# Altium project 实验项目四.PrjPCB
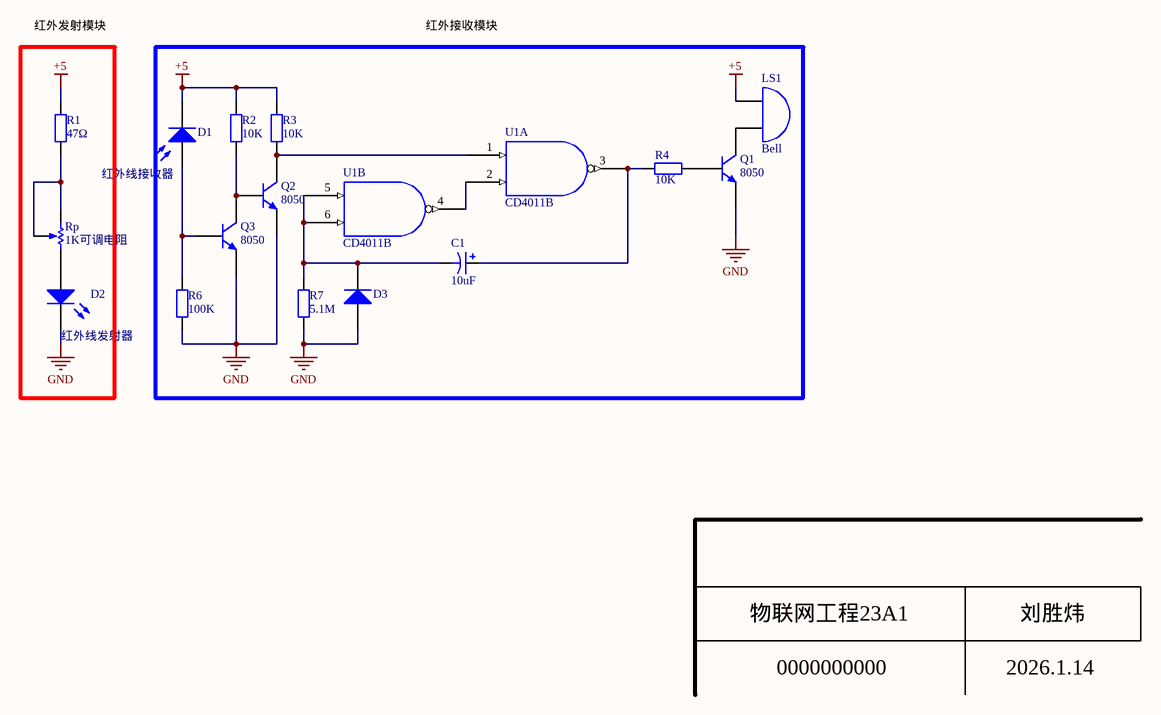
[diagram p0: 实验项目四.SchDoc]
1 sheet, 16 parts. Net scope: global (net labels, ports and power ports of the same name join across sheets).

## Sheet 实验项目四.SchDoc
size A4

### Parts
C1  value 10uF  [POLAR0.8]  (hidden comment: Cap Pol2)
D1  Photo Sen  [PIN2]  (value not drawn)
D2  LED3  [3.5X2.8X1.9]  (value not drawn)
D3  Diode  [SMC]  (value not drawn)
LS1  Bell  [PIN2]
Q1  8050  [SOT-23B_N]
Q2  8050  [SOT-23B_N]
Q3  8050  [SOT-23B_N]
R1  value 47Ω  [AXIAL-0.4]  (hidden comment: Res2)
R2  value 10K  [AXIAL-0.4]  (hidden comment: Res2)
R3  value 10K  [AXIAL-0.4]  (hidden comment: Res2)
R4  value 10K  [AXIAL-0.4]  (hidden comment: Res2)
R6  value 100K  [AXIAL-0.4]  (hidden comment: Res2)
R7  value 5.1M  [AXIAL-0.4]  (hidden comment: Res2)
Rp  1K可调电阻  [VR5]
U1  CD4011B  [DIP-14]  (parts A,B of 4)

### Blocks framed on the sheet
红外接收模块: C1 D1 D3 LS1 Q1-Q3 R2-R4 R6 R7 U1

### Nets
+5: D1.2(K) LS1.1(A) R1.1 R2.2 R3.2
GND: D2.2(K) D3.1(A) Q1.3(E) Q2.3(E) Q3.3(E) R6.1 R7.1 U1.7(GND)
VCC: U1.14(VCC)
NetC1_1: C1.1 R4.2 U1.3
NetC1_2: C1.2 D3.2(K) R7.2 U1.5 U1.6
NetD1_1: D1.1(A) Q3.2(B) R6.2
NetD2_1: D2.1(A) Rp.2(BOT)
NetLS1_2: LS1.2(B) Q1.1(C)
NetQ1_2: Q1.2(B) R4.1
NetQ2_1: Q2.1(C) R3.1 U1.1
NetQ2_2: Q2.2(B) Q3.1(C) R2.1
NetR1_2: R1.2 Rp.1(TOP) Rp.3(TAP)
NetU1_2: U1.2 U1.4

### Notes on the sheet
- 红外发射模块
- 红外线接收器
- (near D2) 红外线发射器
- 物联网工程23A1
- 0000000000
- 2026.1.14
- 刘胜炜

### Library data of the parts
C1 = Cap Pol2: Polarized Capacitor (Axial); Published: 8-Jun-2000; LatestRevisionDate: 17-Jul-2002; LatestRevisionNote: Re-released for DXP Platform.; PackageReference: POLAR0.8; Publisher: Altium Limited; PackageDescription: Polarized Capacitor; 2 Leads
D1 = Photo Sen: Photosensitive Diode; Published: 24-Mar-1999; LatestRevisionDate: 17-Jul-2002; LatestRevisionNote: Re-released for DXP Platform.; PackageReference: PIN2; Publisher: Altium Limited
D2 = LED3: Typical BLUE SiC LED; Published: 8-Jun-2000; LatestRevisionDate: 17-Dec-2003; LatestRevisionNote: PCB Footprint replaced.; DatasheetVersion: 16-Apr-2002; PackageVersion: 16-Apr-2002; PackageReference: 3.5X2.8X1.9; Publisher: Altium Limited; PackageDescription: SM LED; 2 C-Bend Leads; Body 3.5 x 2.8 x 1.9 mm, inc leads (LxWxH typ)
D3 = Diode: Default Diode; Published: 8-Jun-2000; LatestRevisionDate: 17-Jul-2002; LatestRevisionNote: Re-released for DXP Platform.; PackageVersion: Sep-1996; PackageReference: SMC; Publisher: Altium Limited; PackageDescription: DO-214-AB/SMC; 2 C-Bend Leads; Body 7.9 x 5.9 mm, inc. leads (LxW); Code_JEDEC: DO-214-AB
LS1 = Bell: Electrical Bell; Published: 24-Mar-1999; LatestRevisionDate: 17-Jul-2002; LatestRevisionNote: Re-released for DXP Platform.; PackageReference: PIN2; Publisher: Altium Limited
Q1-Q3 = QNPN: NPN Bipolar Transistor; Published: 8-Jun-2000; LatestRevisionDate: 29-May-2009; LatestRevisionNote: IPC-7351 Footprint Added.; PackageVersion: Aug-1999; PackageReference: SOT-23B; Publisher: Altium Limited; PackageDescription: 3-Pin SOT-23 Package 0.95 mm Pitch, 2.4 mm Lead Span
R1-R4 R6 R7 = Res2: Resistor; Published: 8-Jun-2000; LatestRevisionDate: 17-Jul-2002; LatestRevisionNote: Re-released for DXP Platform.; PackageReference: AXIAL-0.4; Publisher: Altium Limited; PackageDescription: Axial Device, Thru-Hole; 2 Leads; 0.4 in Pin Spacing
Rp = RPot: Potentiometer; Sim Note: Enter the Resistance value and the set point into parameter fields.; Set Position: 0.5; Value: 1K; Published: 8-Jun-2000; LatestRevisionDate: 17-Jul-2002; LatestRevisionNote: Re-released for DXP Platform.; PackageReference: VR5; Publisher: Altium Limited; PackageDescription: Variable Resistor, Thru-Hole; 3 Leads
U1 = CD4011B: Quad 2-INPUT Nand G